# EAGLE design Bluetooth_modul_v2 (EAGLE 6.3)
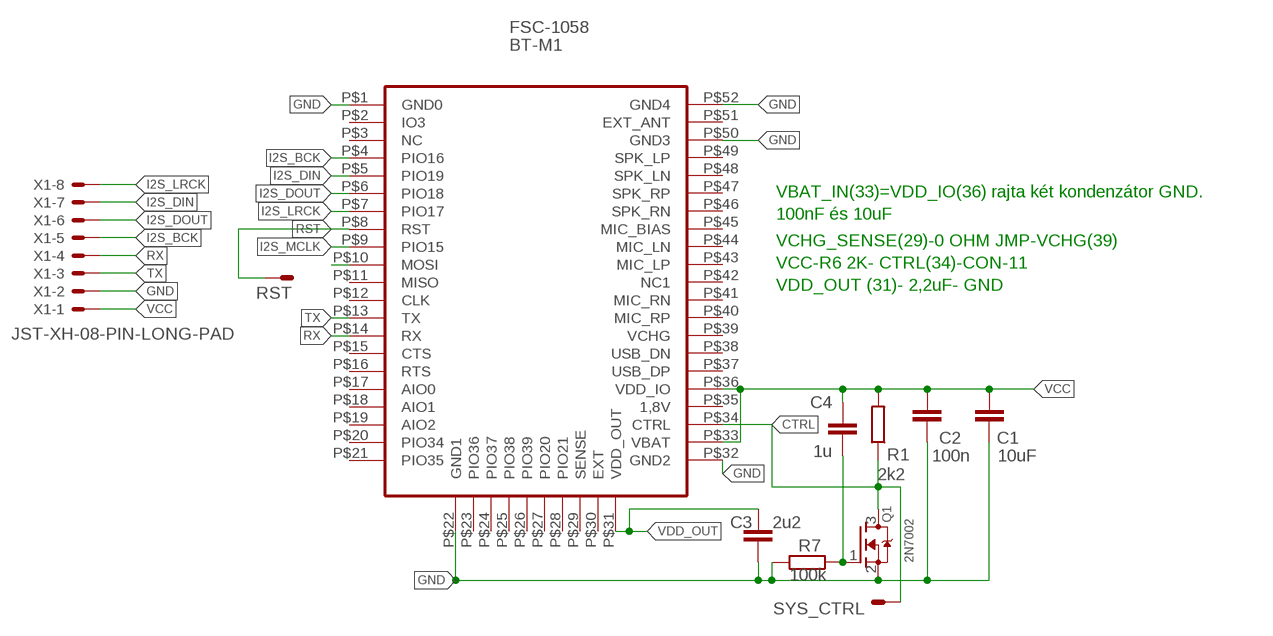
[diagram p0: schematic, sheet 1]

## Parts
BT-M1  FSC-1058  FSC-1054  [FSC-1054]
C1  10uF  C-EUC0805  [C0805]
C2  100n  C-EUC0603  [C0603]
C3  2u2  C-EUC0603  [C0603]
C4  1u  C-EUC0805  [C0805]
Q1  2N7002  MOSFET-NREFLOW  [SOT23]
R1  2k2  R-EU_R0603  [R0603]
R7  100k  R-EU_R0603  [R0603]
RST  PAD1  [PAD1]
SYS_CTRL  PAD1  [PAD1]
X1  JST-XH-08-PIN-LONG-PAD  [JST-XH-08-PACKAGE-LONG-PAD]

## Nets
CTRL: BT-M1.P$34(CTRL) Q1.3(D) R1.1 SYS_CTRL.1(S)
GND: BT-M1.P$1(GND0) BT-M1.P$22(GND1) BT-M1.P$32(GND2) BT-M1.P$50(GND3) BT-M1.P$52(GND4) C1.1 C2.1 C3.1 Q1.2(S) R7.2 X1.2
I2S_BCK: BT-M1.P$4(PIO16) X1.5
I2S_DIN: BT-M1.P$5(PIO19) X1.7
I2S_DOUT: BT-M1.P$6(PIO18) X1.6
I2S_LRCK: BT-M1.P$7(PIO17) X1.8
I2S_MCLK: BT-M1.P$9(PIO15)
N$5: C4.1 Q1.1(G) R7.1
N$7: BT-M1.P$10(MOSI)
RST: BT-M1.P$8(RST) RST.1(S)
RX: BT-M1.P$14(RX) X1.4
TX: BT-M1.P$13(TX) X1.3
VCC: BT-M1.P$33(VBAT) BT-M1.P$36(VDD_IO) C1.2 C2.2 C4.2 R1.2 X1.1
VDD_OUT: BT-M1.P$31(VDD_OUT) C3.2
Unconnected: BT-M1.P$2(IO3) BT-M1.P$3(NC) BT-M1.P$11(MISO) BT-M1.P$12(CLK) BT-M1.P$15(CTS) BT-M1.P$16(RTS) BT-M1.P$17(AIO0) BT-M1.P$18(AIO1) BT-M1.P$19(AIO2) BT-M1.P$20(PIO34) BT-M1.P$21(PIO35) BT-M1.P$23(PIO36) BT-M1.P$24(PIO37) BT-M1.P$25(PIO38) BT-M1.P$26(PIO39) BT-M1.P$27(PIO20) BT-M1.P$28(PIO21) BT-M1.P$29(SENSE) BT-M1.P$30(EXT) BT-M1.P$35(1,8V) BT-M1.P$37(USB_DP) BT-M1.P$38(USB_DN) BT-M1.P$39(VCHG) BT-M1.P$40(MIC_RP) BT-M1.P$41(MIC_RN) BT-M1.P$42(NC1) BT-M1.P$43(MIC_LP) BT-M1.P$44(MIC_LN) BT-M1.P$45(MIC_BIAS) BT-M1.P$46(SPK_RN) BT-M1.P$47(SPK_RP) BT-M1.P$48(SPK_LN) BT-M1.P$49(SPK_LP) BT-M1.P$51(EXT_ANT)

## Notes on the sheet
- VBAT_IN(33)=VDD_IO(36) rajta két kondenzátor GND.
- 100nF és 10uF
- VCHG_SENSE(29)-0 OHM JMP-VCHG(39)
- VCC-R6 2K- CTRL(34)-CON-11
- VDD_OUT (31)- 2,2uF- GND

## Library data of the parts
BT-M1 = SimonZs:FSC-1054
C1-C4 = resistor:C-EU: CAPACITOR, European symbol
Q1 = adafruit1:MOSFET-N: N-Channel Mosfet 2N7002E - 60V 260mA SOT23 [Digikey: 2N7002ET1GOSTR-ND] - REEL BSH103 - 30V 850mA SOT23 [Digikey: 568-5013-1-ND]
R1 R7 = resistor:R-EU_: RESISTOR, European symbol
RST SYS_CTRL = tuskesor:PAD1
X1 = JST XH Connectors v1-0:JST-XH-08-PIN: JST XH Connector 2 Pin Wire to board connector. Pitch: 2,54 mm, (0.100") Number of pins: 8 Created by Rembrandt Electronics www.rembrandtelectronics.com

## Board
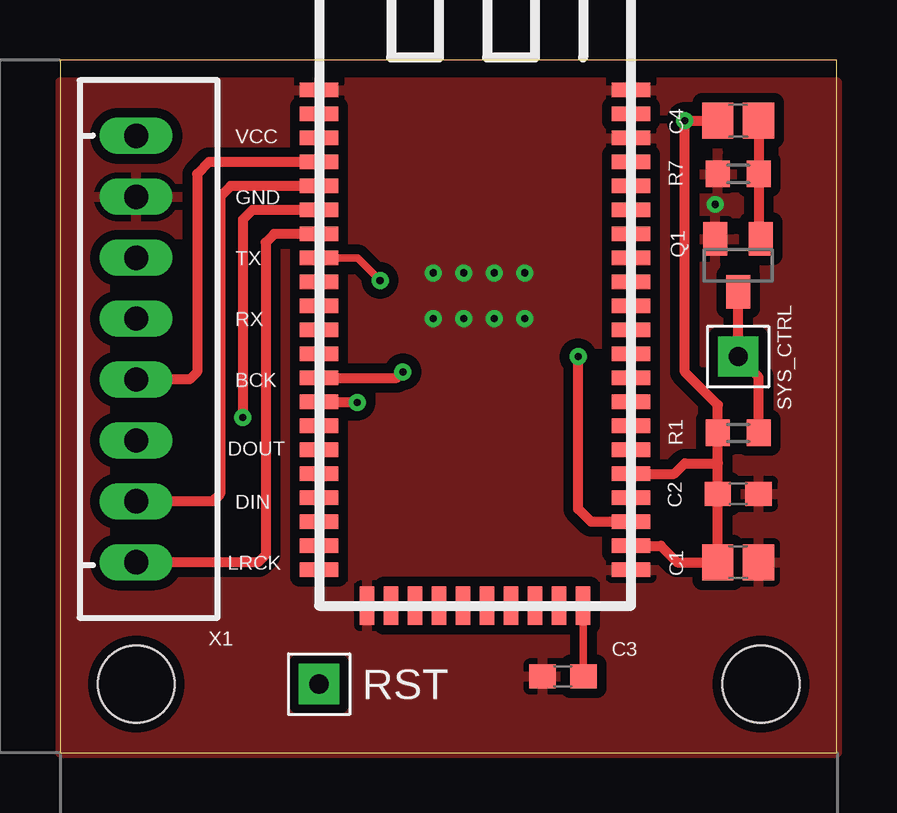
[diagram p1: board, top side]
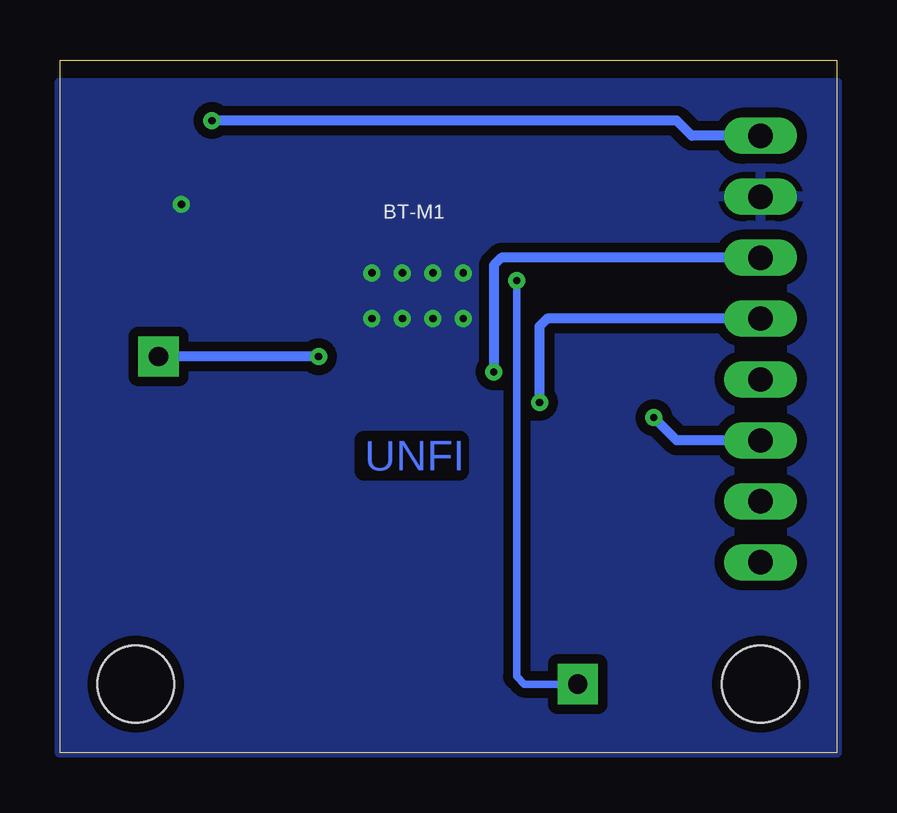
[diagram p2: board, bottom side, seen from below]

Size 32.37 x 28.88 mm. Coordinates in mm from the lower left corner, seen from the top.
Outline: 0,0 32.37,0 32.37,28.88 0,28.88 0,0
Copper layers (1*16): Top 0.035mm / dielectric 1.5mm / Bottom 0.035mm
Design rules "default *": minimum track width 10mil, minimum drill 0.6mm, track to track 8mil, track to pad 8mil, pad to pad 8mil, via to via 8mil, smd to smd 8mil, copper to edge 0mil, drill to drill 8mil, minimum pad ring 10mil, minimum via ring 8mil, stop-mask expansion 4mil, vias tented up to drill 0mil, thermal gap 10mil
Holes 3.2 mm at 3.17,2.86 29.21,2.86

### Footprints (pad centres in the part's own frame; a part is rotated, then mirrored left to right if it is on the bottom)
FSC-1054 = smd 1.6 x 0.6: P$1 0,0; P$2 0,-1; P$3 0,-2; P$4 0,-3; P$5 0,-4; P$6 0,-5; P$7 0,-6; P$8 0,-7; P$9 0,-8; P$10 0,-9; P$11 0,-10; P$12 0,-11; P$13 0,-12; P$14 0,-13; P$15 0,-14; P$16 0,-15; P$17 0,-16; P$18 0,-17; P$19 0,-18; P$20 0,-19; P$21 0,-20; P$32 13,-20; P$33 13,-19; P$34 13,-18; P$35 13,-17; P$36 13,-16; P$37 13,-15; P$38 13,-14; P$39 13,-13; P$40 13,-12; P$41 13,-11; P$42 13,-10; P$43 13,-9; P$44 13,-8; P$45 13,-7; P$46 13,-6; P$47 13,-5; P$48 13,-4; P$49 13,-3; P$50 13,-2; P$51 13,-1; P$52 13,0 | smd 0.6 x 1.6: P$22 2,-21.5; P$23 3,-21.5; P$24 4,-21.5; P$25 5,-21.5; P$26 6,-21.5; P$27 7,-21.5; P$28 8,-21.5; P$29 9,-21.5; P$30 10,-21.5; P$31 11,-21.5
C0805 = smd 1.3 x 1.5: 1 -0.85,0; 2 0.85,0
C0603 = smd 1.1 x 1: 1 -0.85,0; 2 0.85,0
SOT23 = smd 1 x 1.4: 1 -0.95,-1.1; 2 0.95,-1.1; 3 0,1.1
R0603 = smd 1 x 1.1: 1 -0.85,0; 2 0.85,0
PAD1 = drill 0.8 pad 1.676 square: 1 0,0
JST-XH-08-PACKAGE-LONG-PAD = drill 1.016 long: 1 -8.89,0; 2 -6.35,0; 3 -3.81,0; 4 -1.27,0; 5 1.27,0; 6 3.81,0; 7 6.35,0; 8 8.89,0

### Placement (x,y rotation side)
BT-M1  10.79,27.62 0 top
C1  28.26,7.94 180 top
C2  28.26,10.79 180 top
C3  20.95,3.17 0 top
C4  28.26,26.35 180 top
Q1  28.26,20.32 180 top
R1  28.26,13.34 180 top
R7  28.26,24.13 180 top
RST  10.79,2.86 90 top
SYS_CTRL  28.26,16.51 90 top
X1  3.17,16.83 270 top

### Tracks (layer width: path | path; a pad name or v marks a point on that pad's centre or on a via)
CTRL  (via drill 0.3)
  Top 0.406: BT-M1.P$34 22.13,9.62 21.59,10.16 v21.59,16.51 | R1.1 29.11,15.66 SYS_CTRL.1 Q1.3
  Bottom 0.406: v21.59,16.51 SYS_CTRL.1
GND  (via drill 0.3)
  other vias: 27.3,22.86 15.56,20 16.83,20 18.1,20 19.37,20 15.56,18.1 16.83,18.1 18.1,18.1 19.37,18.1
  pour Top (isolate 0.406): 0,0 32.39,0 32.39,27.94 0,27.94
  pour Bottom (isolate 0.406): 0,0 32.39,0 32.39,27.94 0,27.94
I2S_BCK
  Top 0.406: BT-M1.P$4 6.21,24.62 5.71,24.13 5.71,15.88 5.4,15.56 X1.5
I2S_DIN
  Top 0.406: BT-M1.P$5 7.11,23.62 6.67,23.18 6.67,10.79 6.35,10.48 X1.7
I2S_DOUT  (via drill 0.3)
  Top 0.406: BT-M1.P$6 8.02,22.62 7.62,22.22 v7.62,13.97
  Bottom 0.406: X1.6 6.67,13.02 v7.62,13.97
I2S_LRCK
  Top 0.406: BT-M1.P$7 8.92,21.62 8.57,21.27 8.57,8.25 8.26,7.94 X1.8
N$5
  Top 0.406: C4.1 R7.1 29.11,21.52 Q1.1
RST  (via drill 0.3)
  Top 0.305: BT-M1.P$8 12.4,20.62 v13.34,19.68
  Bottom 0.305: v13.34,19.68 13.34,3.17 13.02,2.86 RST.1
RX  (via drill 0.3)
  Top 0.406: BT-M1.P$14 12.37,14.62 v12.38,14.61
  Bottom 0.406: X1.4 12.06,18.1 12.38,17.78 v12.38,14.61
TX  (via drill 0.3)
  Top 0.406: BT-M1.P$13 14.04,15.62 v14.29,15.88
  Bottom 0.406: X1.3 13.97,20.64 14.29,20.32 v14.29,15.88
VCC  (via drill 0.3)
  Top 0.406: 27.41,12.06 C2.2 C1.2 25.72,7.94 25.03,8.62 BT-M1.P$33 | 27.41,12.06 R1.2 27.41,14.5 26.04,15.88 v26.04,26.35 C4.2 | BT-M1.P$36 25.59,11.62 26.04,12.06 27.41,12.06
  Bottom 0.406: X1.1 6.03,25.72 6.67,26.35 v26.04,26.35
VDD_OUT
  Top 0.305: BT-M1.P$31 21.79,3.18 C3.2

### Text on the board
Bottom: UNFI
tNames: VCC | GND | TX | RX | BCK | DOUT | DIN | LRCK